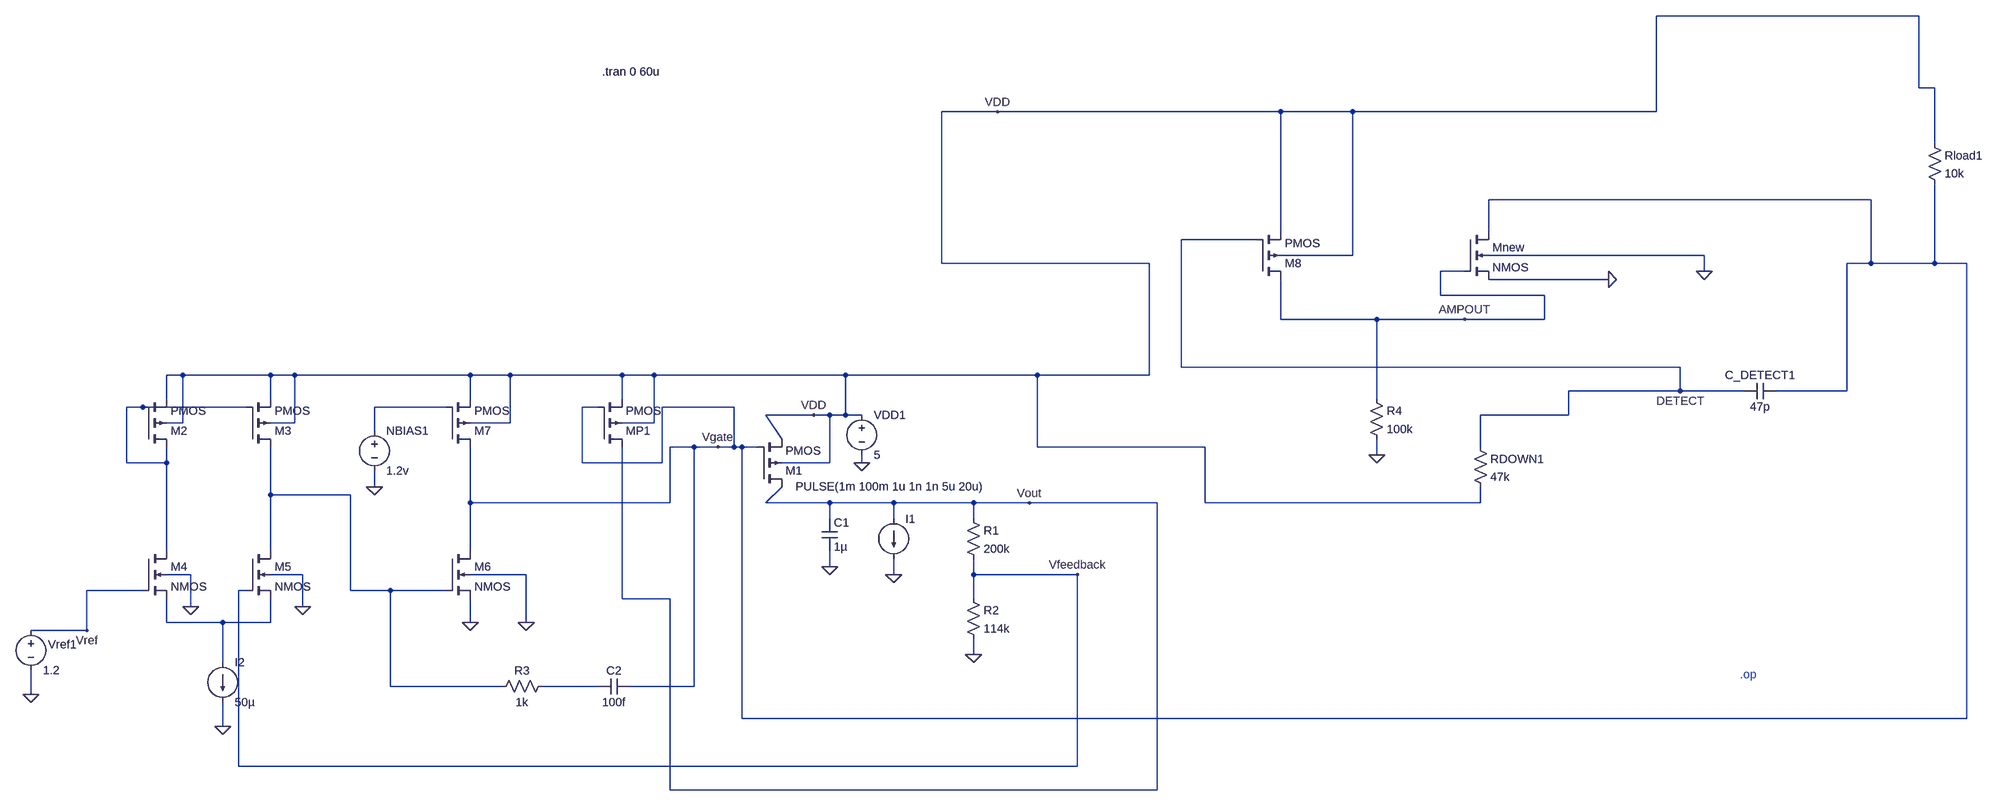
[diagram p0: schematic Transient_Boosted.asc]
Transient_Boosted.asc, the LTspice schematic file:
Version 4.1
SHEET 1 3644 680
WIRE 3152 -992 2496 -992
WIRE 3152 -848 3152 -992
WIRE 3184 -848 3152 -848
WIRE 1168 -800 1056 -800
WIRE 1744 -800 1168 -800
WIRE 1888 -800 1744 -800
WIRE 2496 -800 2496 -992
WIRE 2496 -800 1888 -800
WIRE 3184 -736 3184 -848
WIRE 3056 -624 2160 -624
WIRE 1744 -560 1744 -800
WIRE 2160 -560 2160 -624
WIRE 1696 -544 1536 -544
WIRE 1888 -512 1888 -800
WIRE 1888 -512 1744 -512
WIRE 2592 -512 2160 -512
WIRE 1056 -496 1056 -800
WIRE 1472 -496 1056 -496
WIRE 3056 -496 3056 -624
WIRE 3056 -496 3008 -496
WIRE 3184 -496 3184 -656
WIRE 3184 -496 3056 -496
WIRE 3248 -496 3184 -496
WIRE 2112 -480 2064 -480
WIRE 2592 -480 2592 -512
WIRE 2400 -464 2160 -464
WIRE 2064 -432 2064 -480
WIRE 2272 -432 2064 -432
WIRE 1744 -384 1744 -464
WIRE 1936 -384 1744 -384
WIRE 2112 -384 1936 -384
WIRE 2272 -384 2272 -432
WIRE 2272 -384 2112 -384
WIRE 1536 -288 1536 -544
WIRE 2544 -288 1536 -288
WIRE -464 -272 -496 -272
WIRE -288 -272 -464 -272
WIRE -240 -272 -288 -272
WIRE 112 -272 -240 -272
WIRE 192 -272 112 -272
WIRE 416 -272 192 -272
WIRE 480 -272 416 -272
WIRE 864 -272 480 -272
WIRE 1248 -272 864 -272
WIRE 1472 -272 1472 -496
WIRE 1472 -272 1248 -272
WIRE 2544 -240 2544 -288
WIRE 2544 -240 2320 -240
WIRE 2672 -240 2544 -240
WIRE 3008 -240 3008 -496
WIRE 3008 -240 2736 -240
WIRE -496 -224 -496 -272
WIRE -288 -224 -288 -272
WIRE 112 -224 112 -272
WIRE 416 -224 416 -272
WIRE 1936 -224 1936 -384
WIRE -544 -208 -576 -208
WIRE -336 -208 -544 -208
WIRE 64 -208 -80 -208
WIRE 368 -208 336 -208
WIRE 640 -208 496 -208
WIRE 800 -192 704 -192
WIRE 832 -192 800 -192
WIRE 864 -192 864 -272
WIRE 864 -192 832 -192
WIRE 896 -192 864 -192
WIRE 2320 -192 2320 -240
WIRE 2320 -192 2144 -192
WIRE -464 -176 -464 -272
WIRE -464 -176 -496 -176
WIRE -240 -176 -240 -272
WIRE -240 -176 -288 -176
WIRE 192 -176 192 -272
WIRE 192 -176 112 -176
WIRE 480 -176 480 -272
WIRE 480 -176 416 -176
WIRE -80 -160 -80 -208
WIRE 736 -144 704 -192
WIRE 560 -128 512 -128
WIRE 608 -128 560 -128
WIRE 640 -128 640 -208
WIRE 640 -128 608 -128
WIRE 656 -128 640 -128
WIRE 688 -128 656 -128
WIRE 1248 -128 1248 -272
WIRE 1584 -128 1248 -128
WIRE 2144 -128 2144 -192
WIRE 1936 -112 1936 -144
WIRE -576 -96 -576 -208
WIRE -496 -96 -496 -128
WIRE -496 -96 -576 -96
WIRE 336 -96 336 -208
WIRE 496 -96 496 -208
WIRE 496 -96 336 -96
WIRE 832 -96 832 -192
WIRE 832 -96 736 -96
WIRE 896 -96 896 -112
WIRE -80 -48 -80 -80
WIRE -288 -32 -288 -128
WIRE -128 -32 -288 -32
WIRE 112 -16 112 -128
WIRE 512 -16 512 -128
WIRE 512 -16 112 -16
WIRE 704 -16 736 -48
WIRE 832 -16 704 -16
WIRE 960 -16 832 -16
WIRE 1120 -16 960 -16
WIRE 1232 -16 1120 -16
WIRE 1488 -16 1232 -16
WIRE 1584 -16 1584 -128
WIRE 2144 -16 2144 -48
WIRE 2144 -16 1584 -16
WIRE 832 16 832 -16
WIRE 960 16 960 -16
WIRE 1120 16 1120 -16
WIRE -496 80 -496 -96
WIRE -288 80 -288 -32
WIRE 112 80 112 -16
WIRE 832 112 832 80
WIRE -448 128 -496 128
WIRE -224 128 -288 128
WIRE 224 128 112 128
WIRE 960 128 960 96
WIRE 1120 128 1120 96
WIRE 1328 128 1120 128
WIRE -544 160 -656 160
WIRE -336 160 -352 160
WIRE -128 160 -128 -32
WIRE -48 160 -128 160
WIRE 64 160 -48 160
WIRE 416 176 416 -128
WIRE 512 176 416 176
WIRE 1120 176 1120 128
WIRE -448 192 -448 128
WIRE -224 192 -224 128
WIRE -496 224 -496 176
WIRE -384 224 -496 224
WIRE -288 224 -288 176
WIRE -288 224 -384 224
WIRE 112 224 112 176
WIRE 224 224 224 128
WIRE -656 240 -656 160
WIRE -656 240 -768 240
WIRE 1120 288 1120 256
WIRE -384 304 -384 224
WIRE -48 352 -48 160
WIRE 176 352 -48 352
WIRE 368 352 256 352
WIRE 560 352 560 -128
WIRE 560 352 432 352
WIRE -768 368 -768 320
WIRE 656 416 656 -128
WIRE 3248 416 3248 -496
WIRE 3248 416 656 416
WIRE -384 432 -384 384
WIRE -352 512 -352 160
WIRE 1328 512 1328 128
WIRE 1328 512 -352 512
WIRE 512 560 512 176
WIRE 1488 560 1488 -16
WIRE 1488 560 512 560
FLAG 896 -96 0
FLAG 832 112 0
FLAG 960 128 0
FLAG 1120 288 0
FLAG 800 -192 VDD
FLAG 1232 -16 Vout
FLAG 1328 128 Vfeedback
FLAG 608 -128 Vgate
FLAG -768 368 0
FLAG -656 240 Vref
FLAG -384 432 0
FLAG -224 192 0
FLAG -448 192 0
FLAG -80 -48 0
FLAG 112 224 0
FLAG 224 224 0
FLAG 2112 -384 AMPOUT
FLAG 2544 -240 DETECT
FLAG 1168 -800 VDD
FLAG 2400 -464 0
FLAG 2592 -480 0
FLAG 1936 -112 0
SYMBOL voltage 896 -208 R0
WINDOW 123 0 0 Left 0
WINDOW 39 0 0 Left 0
SYMATTR InstName VDD1
SYMATTR Value 5
SYMBOL cap 816 16 R0
SYMATTR InstName C1
SYMATTR Value 1µ
SYMBOL res 1104 0 R0
SYMATTR InstName R1
SYMATTR Value 200k
SYMBOL res 1104 160 R0
SYMATTR InstName R2
SYMATTR Value 114k
SYMBOL pmos4 688 -48 M180
SYMATTR InstName M1
SYMATTR Value2 l=1u w=200u
SYMBOL voltage -768 224 R0
WINDOW 123 0 0 Left 0
WINDOW 39 0 0 Left 0
WINDOW 0 34 44 Left 2
SYMATTR InstName Vref1
SYMATTR Value 1.2
SYMBOL current 960 16 R0
WINDOW 3 -196 -65 Left 2
WINDOW 123 0 0 Left 0
WINDOW 39 0 0 Left 0
SYMATTR Value PULSE(1m 100m 1u 1n 1n 5u 20u)
SYMATTR InstName I1
SYMBOL pmos4 -544 -128 M180
SYMATTR InstName M2
SYMATTR Value2 l=1u w=10u
SYMBOL pmos4 -336 -128 M180
SYMATTR InstName M3
SYMATTR Value2 l=1u w=10u
SYMBOL nmos4 -544 80 R0
SYMATTR InstName M4
SYMATTR Value2 l=1u w=10u
SYMBOL nmos4 -336 80 R0
SYMATTR InstName M5
SYMATTR Value2 l=1u w=10u
SYMBOL current -384 304 R0
WINDOW 123 0 0 Left 0
WINDOW 39 0 0 Left 0
SYMATTR InstName I2
SYMATTR Value 50µ
SYMBOL nmos4 64 80 R0
SYMATTR InstName M6
SYMATTR Value2 l=1u w=20u
SYMBOL pmos4 64 -128 M180
SYMATTR InstName M7
SYMATTR Value2 l=1u w=20u
SYMBOL voltage -80 -176 R0
WINDOW 123 0 0 Left 0
WINDOW 39 0 0 Left 0
SYMATTR InstName NBIAS1
SYMATTR Value 1.2v
SYMBOL res 272 336 R90
WINDOW 0 0 56 VBottom 2
WINDOW 3 32 56 VTop 2
SYMATTR InstName R3
SYMATTR Value 1k
SYMBOL cap 432 336 R90
WINDOW 0 0 32 VBottom 2
WINDOW 3 32 32 VTop 2
SYMATTR InstName C2
SYMATTR Value 100f
SYMBOL pmos4 368 -128 M180
SYMATTR InstName MP1
SYMATTR Value2 l=1u w=200u
SYMBOL pmos4 1696 -464 M180
SYMATTR InstName M8
SYMATTR Value2 l=180n w=20u
SYMBOL cap 2736 -256 R90
WINDOW 0 0 32 VBottom 2
WINDOW 3 32 32 VTop 2
SYMATTR InstName C_DETECT1
SYMATTR Value 47p
SYMBOL res 2128 -144 R0
SYMATTR InstName RDOWN1
SYMATTR Value 47k
SYMBOL res 3168 -752 R0
SYMATTR InstName Rload1
SYMATTR Value 10k
SYMBOL nmos4 2112 -560 R0
SYMATTR InstName Mnew
SYMATTR Value2 l=1u w=100u
SYMBOL res 1920 -240 R0
SYMATTR InstName R4
SYMATTR Value 100k
TEXT 2664 328 Left 2 ;.op
TEXT 376 -880 Left 2 !.tran 0 60u

The netlist it stands for:
* Transient_Boosted.asc
VDD1 VDD 0 5
C1 Vout 0 1µ
R1 Vout Vfeedback 200k
R2 Vfeedback 0 114k
M1 Vout Vgate VDD VDD PMOS l=1u w=200u
Vref1 Vref 0 1.2
I1 Vout 0 PULSE(1m 100m 1u 1n 1n 5u 20u)
M2 N001 N001 VDD VDD PMOS l=1u w=10u
M3 N003 N001 VDD VDD PMOS l=1u w=10u
M4 N001 Vref N004 0 NMOS l=1u w=10u
M5 N003 Vfeedback N004 0 NMOS l=1u w=10u
I2 N004 0 50µ
M6 Vgate N003 0 0 NMOS l=1u w=20u
M7 Vgate N002 VDD VDD PMOS l=1u w=20u
V§NBIAS1 N002 0 1.2v
R3 N005 N003 1k
C2 Vgate N005 100f
MP1 Vout Vgate VDD VDD PMOS l=1u w=200u
M8 AMPOUT DETECT VDD VDD PMOS l=180n w=20u
C_DETECT1 Vgate DETECT 47p
RDOWN1 DETECT VDD 47k
Rload1 VDD Vgate 10k
Mnew Vgate AMPOUT 0 0 NMOS l=1u w=100u
R4 AMPOUT 0 100k
.model NMOS NMOS
.model PMOS PMOS
.lib standard.mos
* .op
.tran 0 60u
.backanno
.end